# Altium schematic sheet push-button-switch-6.SchDoc
size A4; SheetNumber: 6; SheetTotal: 17
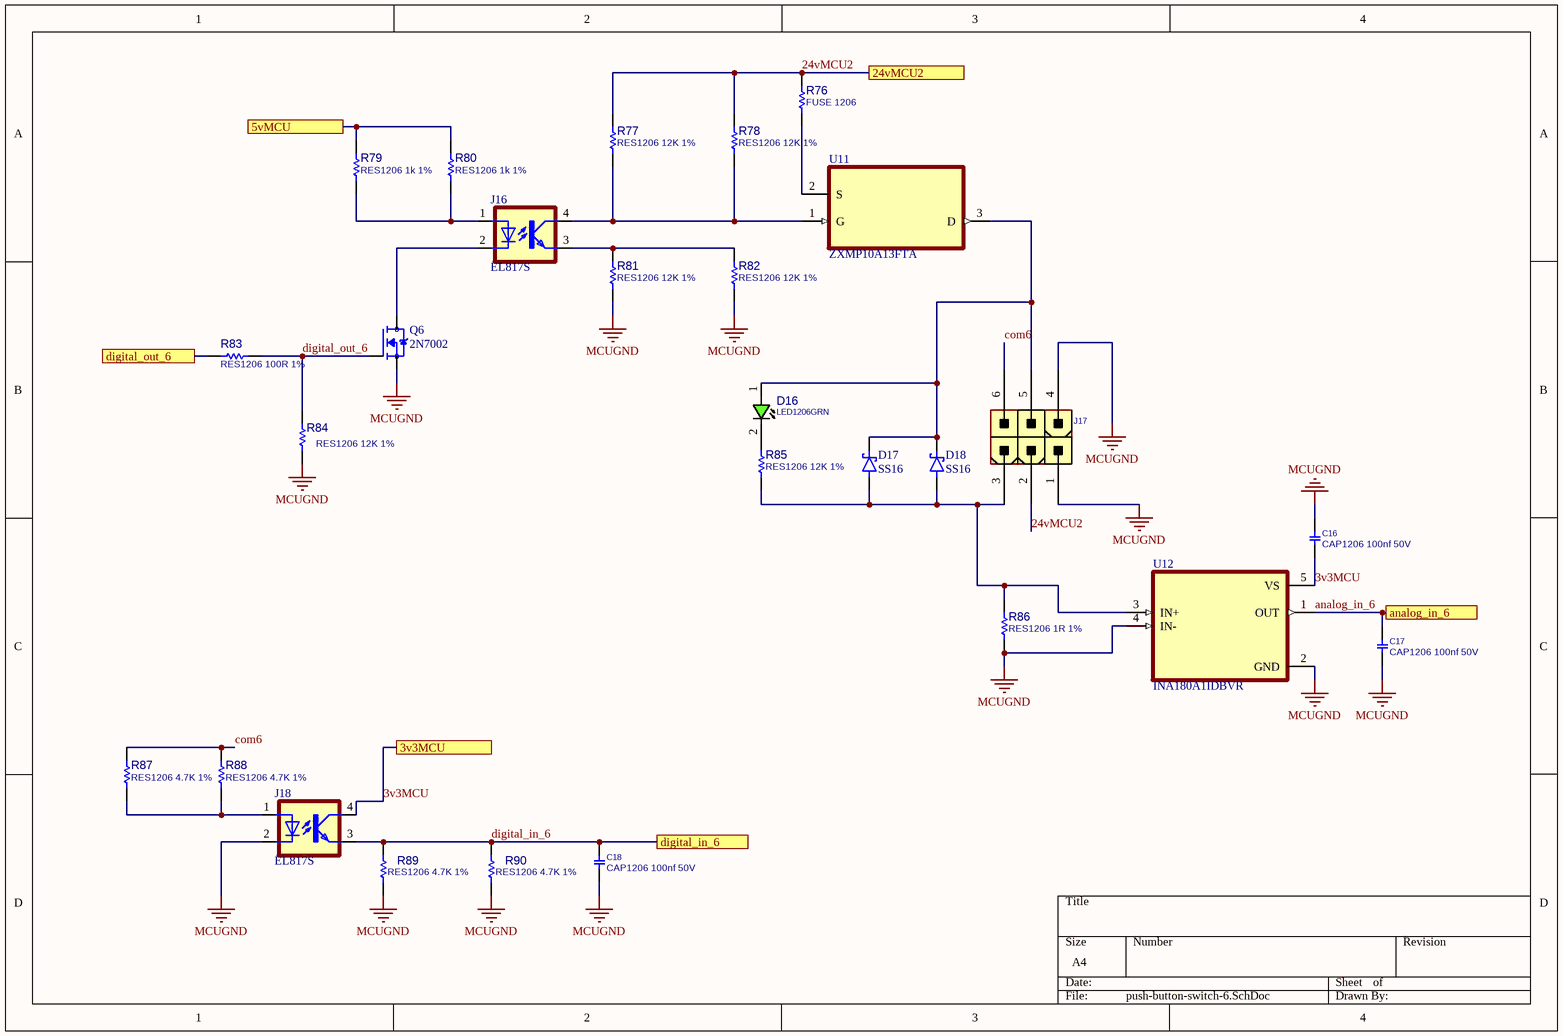
[diagram p0: push-button-switch-6.SchDoc]

## Parts
C16  CAP1206 100nf 50V  [C1206]
C17  CAP1206 100nf 50V  [C1206]
C18  CAP1206 100nf 50V  [C1206]
D16  LED1206GRN  [LED1206GRN]
D17  SS16  [DIOM4325X250N]
D18  SS16  [DIOM4325X250N]
J16  EL817S  [SOIC254P1030X460-4N]
J17  CONN_ATXPWR_6  [ATXPWR_6]  (value not drawn)
J18  EL817S  [SOIC254P1030X460-4N]
Q6  2N7002  [SOT95P240X111-3N]
R76  FUSE 1206  [R1206]
R77  RES1206 12K 1%  [R1206]
R78  RES1206 12K 1%  [R1206]
R79  RES1206 1k 1%  [R1206]
R80  RES1206 1k 1%  [R1206]
R81  RES1206 12K 1%  [R1206]
R82  RES1206 12K 1%  [R1206]
R83  RES1206 100R 1%  [R1206]
R84  RES1206 12K 1%  [R1206]
R85  RES1206 12K 1%  [R1206]
R86  RES1206 1R 1%  [R1206]
R87  RES1206 4.7K 1%  [R1206]
R88  RES1206 4.7K 1%  [R1206]
R89  RES1206 4.7K 1%  [R1206]
R90  RES1206 4.7K 1%  [R1206]
U11  ZXMP10A13FTA  [SOT95P230X110-3N]
U12  INA180A1IDBVR  [SOT95P280X145-5N]

## Ports
3v3MCU, 5vMCU, 24vMCU2, analog_in_6, digital_in_6, digital_out_6

## Nets
MCUGND: C16.1 C17.2 C18.2 J17.1 J17.4 J18.2(C) Q6.2(S) R81.2 R82.2 R84.2 R86.2 R89.1 R90.1 U12.2(GND) U12.4(IN-)
3v3MCU: C16.2 J18.4(COL) U12.5(VS) ; port 3v3MCU
5vMCU: R79.2 R80.2 ; port 5vMCU
24vMCU2: J17.2 R76.1 R77.1 R78.1 ; port 24vMCU2
analog_in_6: C17.1 U12.1(OUT) ; port analog_in_6
com6: J17.6 R87.2 R88.2
digital_in_6: C18.1 J18.3(EMIT) R89.2 R90.2 ; port digital_in_6
digital_out_6: Q6.1(G) R83.2 R84.1
digital_out_6: R83.1 ; port digital_out_6  [a separate net that carries the same name]
NetD16_1: D16.1(ANODE) D17.C(K) D18.C(K) J17.5 U11.3(D)
NetD16_2: D16.2(CATHODE) R85.1
NetD17_A: D17.A D18.A J17.3 R85.2 R86.1 U12.3(IN+)
NetJ16_1: J16.1(A) R79.1 R80.1
NetJ16_2: J16.2(C) Q6.3(D)
NetJ16_3: J16.3(EMIT) R81.1 R82.1
NetJ16_4: J16.4(COL) R77.2 R78.2 U11.1(G)
NetJ18_1: J18.1(A) R87.1 R88.1
NetR76_2: R76.2 U11.2(S)

## Library data of the parts
C16-C18 = CAP_SMD_MLCC_1206: CAP, MLCC; PARAM: -, -%; MANF_P#: MANF_PART#; PARAM2: -V; PRICE: 100= 1$; MANF: -; ASSEMBLY: ASSEMBLY
D16 = LED_SMD_1206_GRN: LED, SMD, 1206, GREEN; PARAM: 20mA; DESC: DESCRIPTION; PARAM2: 2.2V; MANF: -; ASSEMBLY: ASSEMBLY; PRICE: 36t@Javan; MANF_P#: -; VALUE: LED1206GRN; MountType: SMT; PartType: LED
D17 D18 = SS14: 1A, 40V, Schottky Rectifier; MF: Taiwan Semiconductor; SnapEDA_Link: https://www.snapeda.com/parts/SS14/taiwan/view-part/?ref=snap; Package: SMA-2 Taiwan Semiconductor; Value: *; MP: SS14; Check_prices: https://www.snapeda.com/parts/SS14/taiwan/view-part/?ref=eda
J16 J18 = EL817S: Optoisolator Transistor Output 5000Vrms 1 Channel 4-SMD; MF: Everlight Electronics; SnapEDA_Link: https://www.snapeda.com/parts/EL817S/Everlight+Electronics+Co+Ltd/view-part/?ref=snap; Package: SMD-4 Everlight Electronics Co Ltd; Value: *; MP: EL817S; Check_prices: https://www.snapeda.com/parts/EL817S/Everlight+Electronics+Co+Ltd/view-part/?ref=eda
J17 = CONN_ATXPWR_6: CONN, ATX POWER, 6 P; MANF: TE; MANF_P#: 4-1775099-1; VALUE: CONN_ATXPWR_6; MountType: THD; PACKAGE: ATXPWR-6pin; Part Type: Conn.
Q6 = 2N7002: N-Channel 60V 280mA (Ta) 350mW (Ta) Surface Mount SOT-23-3 (TO-236); MF: {'manufacturer': u'onsemi'}; Package: None; Price: None; Value: *; MP: 2N7002; Availability: Unavailable
R76-R90 = RES_SMD_1206: RESISTOR, SMD; PARAM: 1%, 0.25W; DESC: DESCRIPTION; DIST#: MOUSER; MANF_P#: -; MANF: -; ASSEMBLY: ASSEMBLY; PRICE: -; PARAM2: -
U11 = ZXMP10A13FTA: P-Channel 100 V 600mA (Ta) 625mW (Ta) Surface Mount SOT-23-3; MF: Diodes Inc.; Purchase-URL: https://pricing.snapeda.com/search/part/ZXMP10A13FTA/?ref=eda; Package: SOT-23-3 Diodes Inc.; SnapEDA_Link: https://www.snapeda.com/parts/ZXMP10A13FTA/Diodes+Inc./view-part/?ref=snap; Availability: In Stock; Value: *; MP: ZXMP10A13FTA; Check_prices: https://www.snapeda.com/parts/ZXMP10A13FTA/Diodes+Inc./view-part/?ref=eda; Price: None
U12 = INA180A1IDBVR: 26V, 350kHz current sense amplifier; MF: Texas Instruments; SnapEDA_Link: https://www.snapeda.com/parts/INA180A1IDBVR/Texas+Instruments/view-part/?ref=snap; Package: SOT-23-5 Texas Instruments; Value: *; MP: INA180A1IDBVR; Check_prices: https://www.snapeda.com/parts/INA180A1IDBVR/Texas+Instruments/view-part/?ref=eda